# Altium schematic sheet Amplifier.SchDoc
size A; SheetNumber: 4; SheetTotal: 5
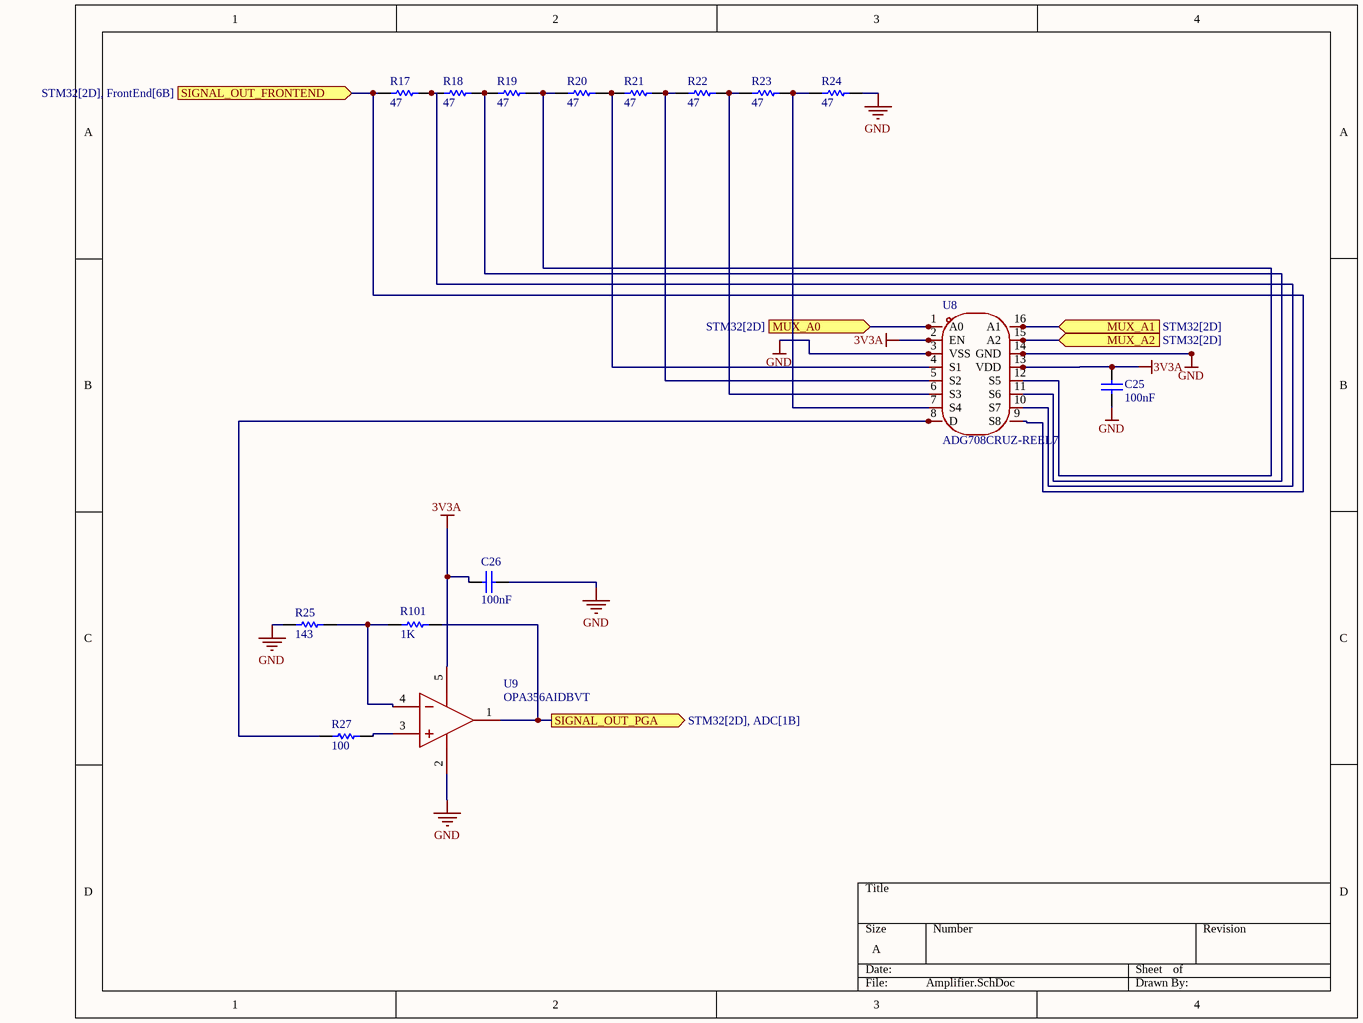
[diagram p0: Amplifier.SchDoc]

## Parts
C25  value 100nF  [0603]  (hidden comment: Cap)
C26  value 100nF  [0603]  (hidden comment: Cap)
R17  value 47  [0603]  (hidden comment: Res1)
R18  value 47  [0603]  (hidden comment: Res1)
R19  value 47  [0603]  (hidden comment: Res1)
R20  value 47  [0603]  (hidden comment: Res1)
R21  value 47  [0603]  (hidden comment: Res1)
R22  value 47  [0603]  (hidden comment: Res1)
R23  value 47  [0603]  (hidden comment: Res1)
R24  value 47  [0603]  (hidden comment: Res1)
R25  value 143  [0603]  (hidden comment: Res1)
R27  value 100  [0603]  (hidden comment: Res1)
R101  value 1K  [0603]  (hidden comment: Res1)
U8  ADG708CRUZ-REEL7  [TSSOP-16]
U9  OPA356AIDBVT  [SOT-23-5]

## Ports
MUX_A0 (in, see STM32[2D]), MUX_A1 (in, see STM32[2D]), MUX_A2 (in, see STM32[2D]), SIGNAL_OUT_FRONTEND (in, see STM32[2D], FrontEnd[6B]), SIGNAL_OUT_PGA (out, see STM32[2D], ADC[1B])

## Nets
3V3A: C25.2 C26.1 U8.2(EN) U8.13(VDD) U9.5(V+)
GND: C25.1 C26.2 R24.1 R25.1 U8.3(VSS) U8.14(GND) U9.2(V-)
MUX_A0: U8.1(A0) ; port MUX_A0
MUX_A1: U8.16(A1) ; port MUX_A1
MUX_A2: U8.15(A2) ; port MUX_A2
SIGNAL_OUT_FRONTEND: R17.2 U8.9(S8) ; port SIGNAL_OUT_FRONTEND
SIGNAL_OUT_PGA: R101.2 U9.1(OUT) ; port SIGNAL_OUT_PGA
NetR17_1: R17.1 R18.2 U8.10(S7)
NetR18_1: R18.1 R19.2 U8.11(S6)
NetR19_1: R19.1 R20.2 U8.12(S5)
NetR20_1: R20.1 R21.2 U8.4(S1)
NetR21_1: R21.1 R22.2 U8.5(S2)
NetR22_1: R22.1 R23.2 U8.6(S3)
NetR23_1: R23.1 R24.2 U8.7(S4)
NetR25_2: R25.2 R101.1 U9.4(IN-)
NetR27_1: R27.1 U9.3(IN+)
NetR27_2: R27.2 U8.8(D)

## Library data of the parts
C25 C26 = Cap: Capacitor; Published: 8-Jun-2000; LatestRevisionDate: 17-Jul-2002; LatestRevisionNote: Re-released for DXP Platform.; PackageReference: RAD-0.3; Publisher: Altium Limited; PackageDescription: Radial Cap, Thru-Hole; 2 Leads; 0.3 in Pin Spacing
R17-R25 R27 R101 = Res1: Resistor; Published: 8-Jun-2000; LatestRevisionDate: 17-Jul-2002; LatestRevisionNote: Re-released for DXP Platform.; PackageReference: AXIAL-0.3; Publisher: Altium Limited; PackageDescription: Axial Device, Thru-Hole; 2 Leads; 0.3 in Pin Spacing
U8 = ADG708CRUZ-REEL7: 8:1 low-voltage analog multiplexer/switch, 4.5 Ω max RON, 55 MHz bandwidth
U9 = OPA356AIDBVT: High-speed CMOS single operational amplifier, 200 MHz GBW, rail-to-rail output